# Altium schematic sheet QSTL_THS3491_RGT_G20_RevC.SchDoc
size 406 x 279 mm
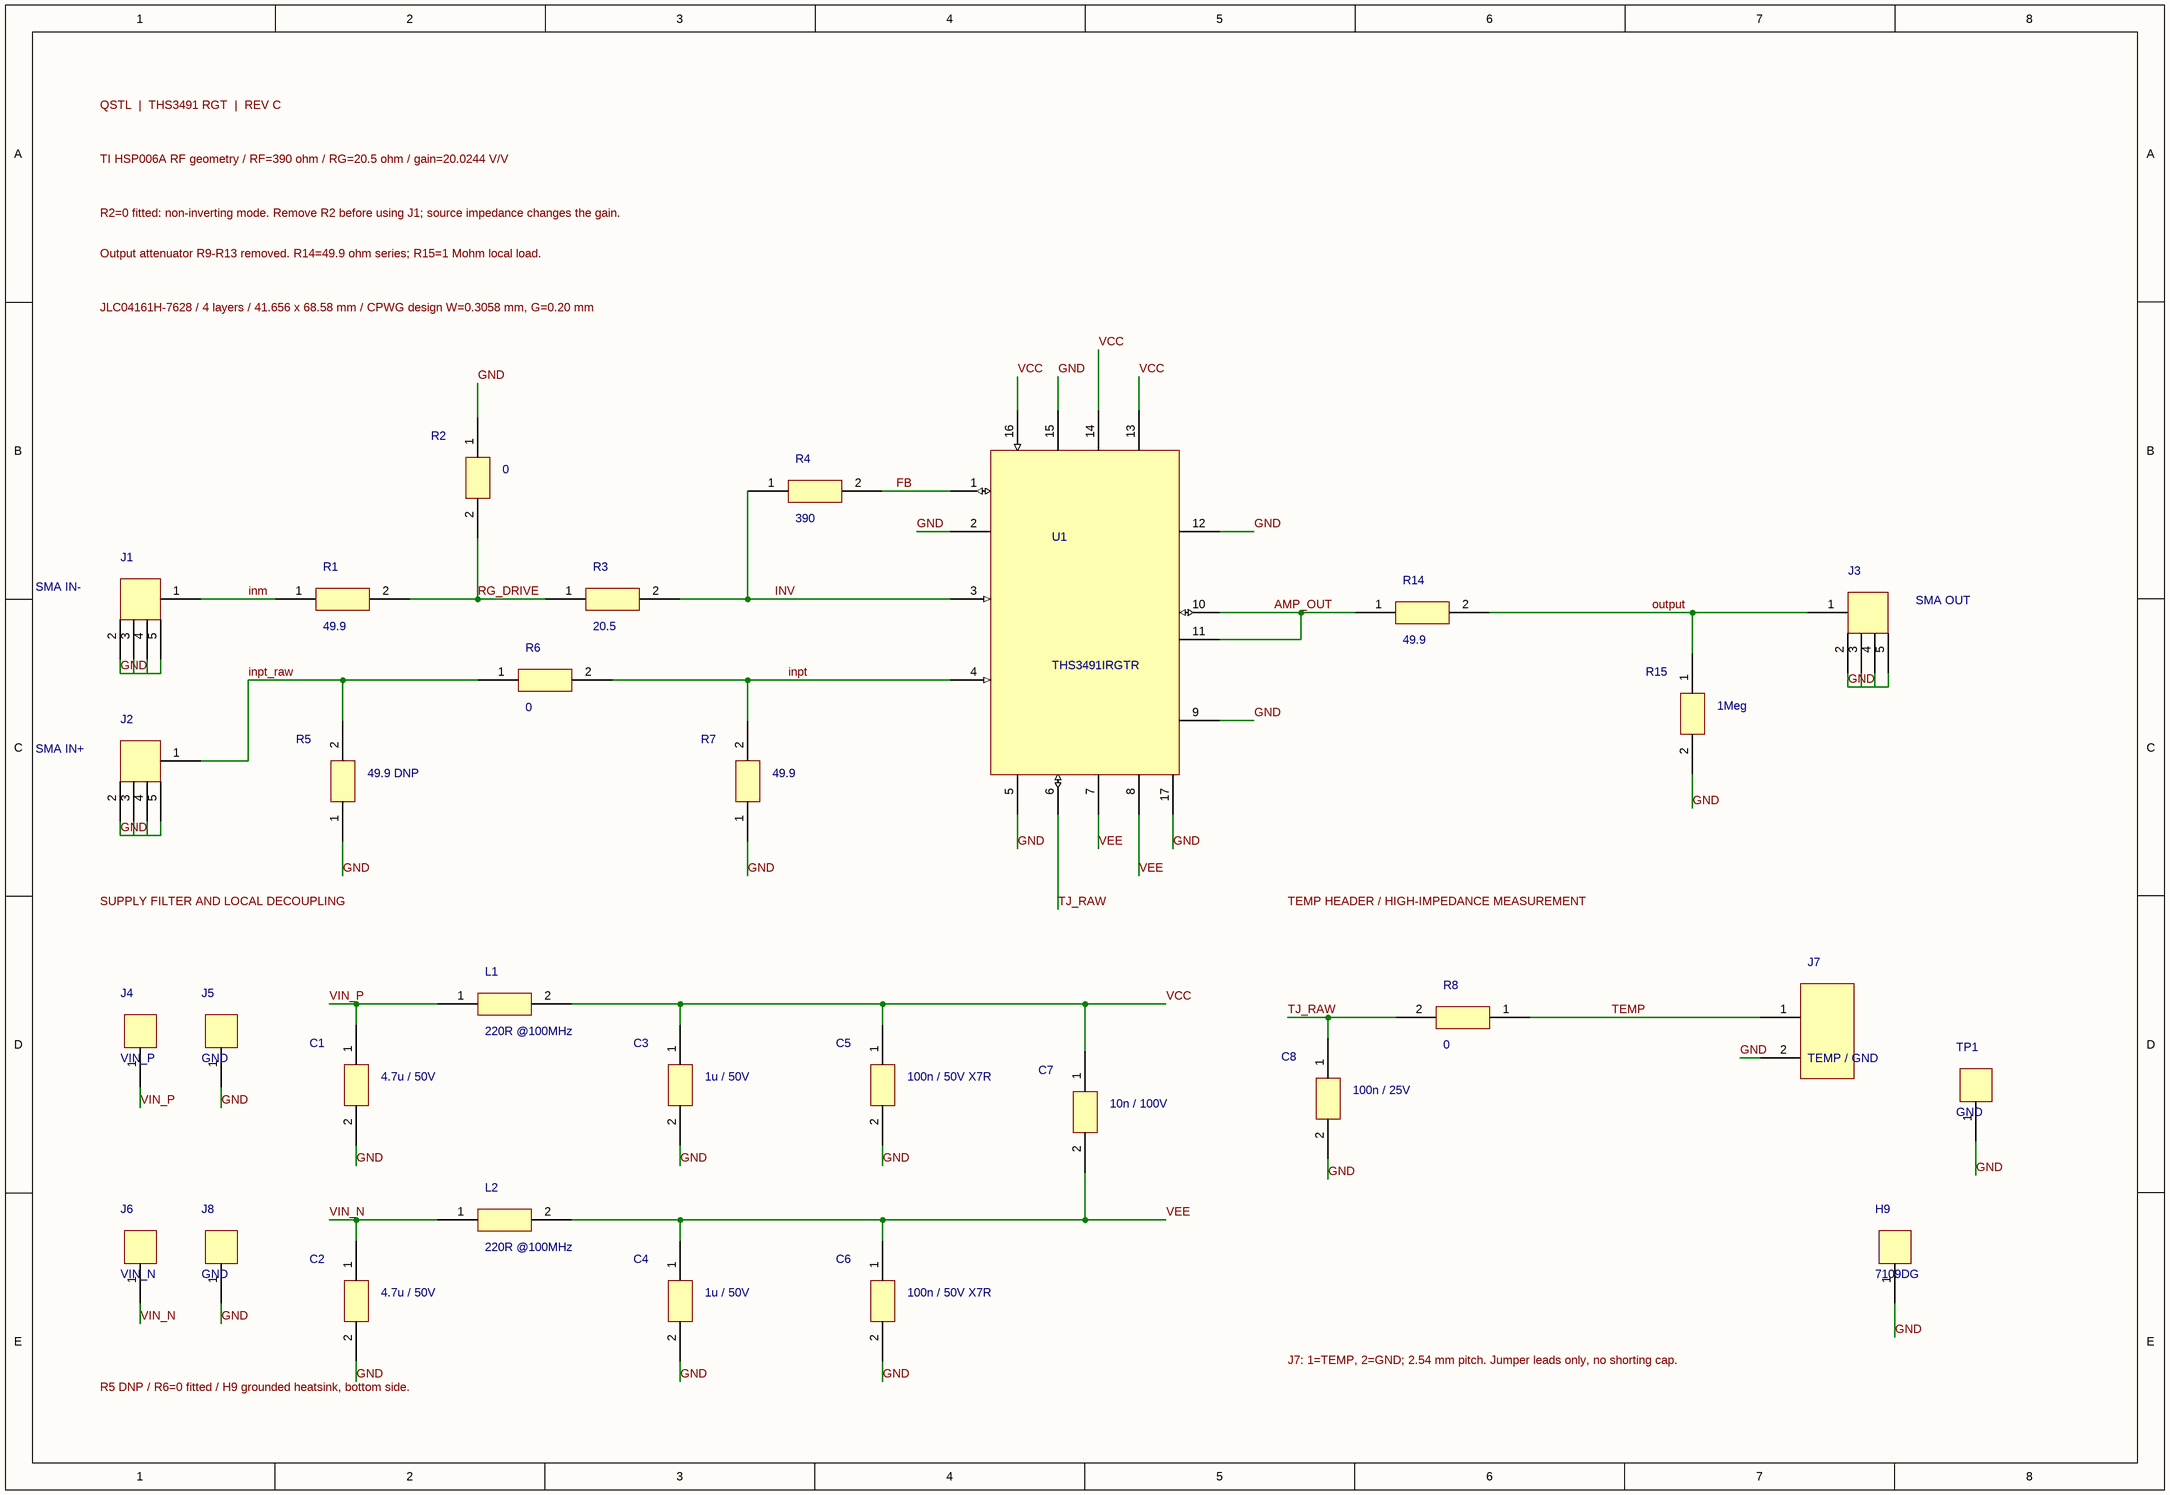
[diagram p0: QSTL_THS3491_RGT_G20_RevC.SchDoc]

## Parts
C1  4.7u / 50V  [1206]
C2  4.7u / 50V  [1206]
C3  1u / 50V  [0805L]
C4  1u / 50V  [0805L]
C5  100n / 50V X7R  [0603L]
C6  100n / 50V X7R  [0603L]
C7  10n / 100V  [0603L]
C8  100n / 25V  [0402L]
H9  7109DG  [Aavid_7109DG]
J1  SMA IN-  [Emerson_142-0701-851]
J2  SMA IN+  [Emerson_142-0701-851]
J3  SMA OUT  [Emerson_142-0701-851]
J4  VIN_P  [WIRE_PAD]
J5  GND  [WIRE_PAD]
J6  VIN_N  [WIRE_PAD]
J7  TEMP / GND  [PinHeader_1x02_P2.54mm_Vertical]
J8  GND  [WIRE_PAD]
L1  220R @100MHz  [0805_HV]
L2  220R @100MHz  [0805_HV]
R1  49.9  [0603L]
R2  0  [0603L]
R3  20.5  [0603L]
R4  390  [0603L]
R5  49.9 DNP  [0603L]
R6  0  [0603L]
R7  49.9  [0603L]
R8  0  [0603L]
R14  49.9  [R_0603_1608Metric]
R15  1Meg  [R_0805_2012Metric]
TP1  GND  [CC_TP105-01-09]
U1  THS3491IRGTR  [RGT0016A]

## Nets
AMP_OUT: R14.1 U1.10(OUT) U1.11(OUT)
FB: R4.2 U1.1(FB)
GND: C1.2 C2.2 C3.2 C4.2 C5.2 C6.2 C8.2 H9.1 J1.2(GND) J1.3(GND) J1.4(GND) J1.5(GND) J2.2(GND) J2.3(GND) J2.4(GND) J2.5(GND) J3.2(GND) J3.3(GND) J3.4(GND) J3.5(GND) J5.1 J7.2(GND) J8.1 R2.1 R5.1 R7.1 R15.2 TP1.1 U1.2(NC/GND) U1.5(GND) U1.9(NC/GND) U1.12(NC/GND) U1.15(NC) U1.17(EP)
inm: J1.1(SIG) R1.1
inpt: R6.2 R7.2 U1.4(IN+)
inpt_raw: J2.1(SIG) R5.2 R6.1
INV: R3.2 R4.1 U1.3(IN-)
output: J3.1(SIG) R14.2 R15.1
RG_DRIVE: R1.2 R2.2 R3.1
TEMP: J7.1(TEMP) R8.1
TJ_RAW: C8.1 R8.2 U1.6(TEMP)
VCC: C3.1 C5.1 C7.1 L1.2 U1.13(V+) U1.14(V+) U1.16(PDn)
VEE: C4.1 C6.1 C7.2 L2.2 U1.7(V-) U1.8(V-)
VIN_N: C2.1 J6.1 L2.1
VIN_P: C1.1 J4.1 L1.1

## Notes on the sheet
- QSTL  |  THS3491 RGT  |  REV C
- TI HSP006A RF geometry / RF=390 ohm / RG=20.5 ohm / gain=20.0244 V/V
- R2=0 fitted: non-inverting mode. Remove R2 before using J1; source impedance changes the gain.
- Output attenuator R9-R13 removed. R14=49.9 ohm series; R15=1 Mohm local load.
- JLC04161H-7628 / 4 layers / 41.656 x 68.58 mm / CPWG design W=0.3058 mm, G=0.20 mm
- SUPPLY FILTER AND LOCAL DECOUPLING
- TEMP HEADER / HIGH-IMPEDANCE MEASUREMENT
- J7: 1=TEMP, 2=GND; 2.54 mm pitch. Jumper leads only, no shorting cap.
- R5 DNP / R6=0 fitted / H9 grounded heatsink, bottom side.

## Library data of the parts
C1 C2 = GRM319R61H475KA12D: MPN: GRM319R61H475KA12D; LCSC: C415529
C3 C4 = C2012X5R1H105KT000N: MPN: C2012X5R1H105KT000N; LCSC: C49296934
C5 C6 = CL10B104KB8NNNC: MPN: CL10B104KB8NNNC; LCSC: C1591
C7 = 06031C103KAT2A: MPN: 06031C103KAT2A; LCSC: C2167322
C8 = GRM155R61E104KA87D: MPN: GRM155R61E104KA87D; LCSC: C77008
J1-J3 = 142-0701-851: MPN: 142-0701-851
J4 = WIRE_SOLDER_PADS: MPN: WIRE_SOLDER_PADS
J7 = GENERIC_1x02_2.54mm: MPN: GENERIC_1x02_2.54mm
L1 L2 = BLM21PG221SN1D: MPN: BLM21PG221SN1D; LCSC: C85840
R1 R5 R7 R14 = CRCW060349R9FKEA: MPN: CRCW060349R9FKEA; LCSC: C844930
R2 R6 R8 = CRCW06030000Z0EA: MPN: CRCW06030000Z0EA; LCSC: C844915
R3 = RC0603FR-0720R5L: MPN: RC0603FR-0720R5L; LCSC: C245934
R4 = CRCW0603390RFKEAHP: MPN: CRCW0603390RFKEAHP; LCSC: C313742
R15 = CRCW08051M00FKEA: MPN: CRCW08051M00FKEA; LCSC: C844825
TP1 = PCB_TEST_PAD: MPN: PCB_TEST_PAD
H9 = 7109DG: MPN: 7109DG; LCSC: C2844701
J5 J8 = GND: MPN: GND
J6 = VIN_N: MPN: VIN_N
U1 = THS3491IRGTR: MPN: THS3491IRGTR; LCSC: C2058688